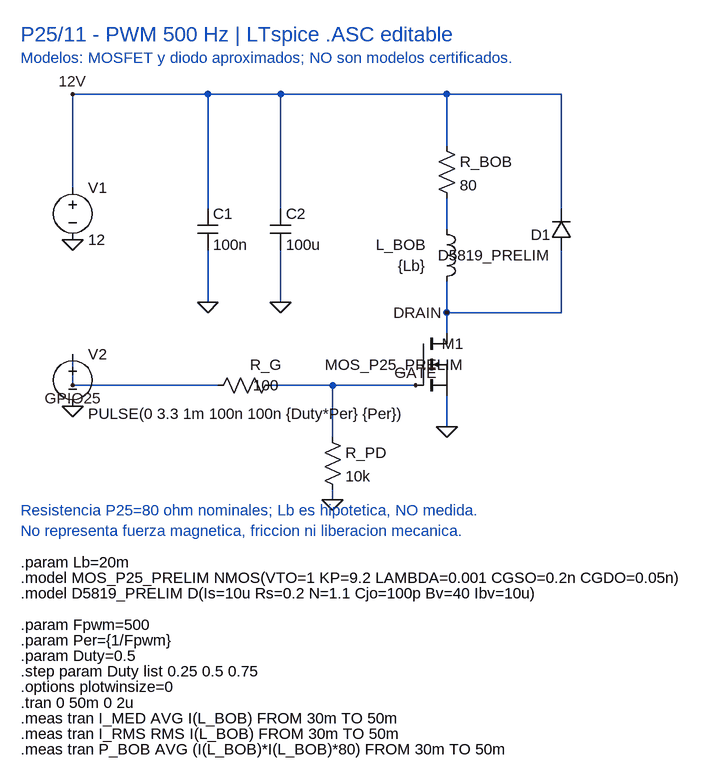
[diagram p0: schematic 03_P25_PWM_25_50_75.asc]
03_P25_PWM_25_50_75.asc, the LTspice schematic file:
Version 4
SHEET 1 1600 1200
WIRE 128 112 336 112
WIRE 336 112 448 112
WIRE 448 112 704 112
WIRE 704 112 880 112
WIRE 128 112 128 256
WIRE 336 112 336 288
WIRE 336 352 336 432
WIRE 448 112 448 288
WIRE 448 352 448 432
WIRE 704 112 704 192
WIRE 704 272 704 320
WIRE 704 400 704 448
WIRE 704 448 704 480
WIRE 704 576 704 624
WIRE 880 112 880 288
WIRE 880 352 880 448
WIRE 704 448 880 448
WIRE 128 512 128 560
WIRE 128 560 352 560
WIRE 432 560 528 560
WIRE 528 560 656 560
WIRE 528 560 528 640
WIRE 528 720 528 736
FLAG 128 112 12V
FLAG 704 448 DRAIN
FLAG 656 560 GATE
FLAG 128 560 GPIO25
FLAG 128 336 0
FLAG 128 592 0
FLAG 336 432 0
FLAG 448 432 0
FLAG 528 736 0
FLAG 704 624 0
SYMBOL voltage 128 240 R0
SYMATTR InstName V1
SYMATTR Value 12
SYMBOL cap 320 288 R0
SYMATTR InstName C1
SYMATTR Value 100n
SYMBOL cap 432 288 R0
SYMATTR InstName C2
SYMATTR Value 100u
SYMBOL res 688 176 R0
SYMATTR InstName R_BOB
SYMATTR Value 80
SYMBOL ind 688 304 R0
WINDOW 0 -16 40 Right 2
WINDOW 3 -16 72 Right 2
SYMATTR InstName L_BOB
SYMATTR Value {Lb}
SYMBOL nmos 656 480 R0
WINDOW 0 74 16 Right 2
WINDOW 3 74 48 Right 2
SYMATTR InstName M1
SYMATTR Value MOS_P25_PRELIM
SYMBOL res 448 544 R90
WINDOW 0 0 22 VBottom 2
WINDOW 3 0 22 VTop 2
SYMATTR InstName R_G
SYMATTR Value 100
SYMBOL res 512 624 R0
SYMATTR InstName R_PD
SYMATTR Value 10k
SYMBOL diode 896 352 R180
WINDOW 0 32 24 Left 2
WINDOW 3 32 -8 Left 2
SYMATTR InstName D1
SYMATTR Value D5819_PRELIM
SYMBOL voltage 128 496 R0
WINDOW 3 24 108 Left 2
SYMATTR InstName V2
SYMATTR Value PULSE(0 3.3 1m 100n 100n {Duty*Per} {Per})
TEXT 48 20 Left 3 P25/11 - PWM 500 Hz | LTspice .ASC editable
TEXT 48 56 Left 2 Modelos: MOSFET y diodo aproximados; NO son modelos certificados.
TEXT 48 752 Left 2 Resistencia P25=80 ohm nominales; Lb es hipotetica, NO medida.
TEXT 48 784 Left 2 No representa fuerza magnetica, friccion ni liberacion mecanica.
TEXT 48 832 Left 2 !.param Lb=20m
TEXT 48 856 Left 2 !.model MOS_P25_PRELIM NMOS(VTO=1 KP=9.2 LAMBDA=0.001 CGSO=0.2n CGDO=0.05n)
TEXT 48 880 Left 2 !.model D5819_PRELIM D(Is=10u Rs=0.2 N=1.1 Cjo=100p Bv=40 Ibv=10u)
TEXT 48 928 Left 2 !.param Fpwm=500
TEXT 48 952 Left 2 !.param Per={1/Fpwm}
TEXT 48 976 Left 2 !.param Duty=0.5
TEXT 48 1000 Left 2 !.step param Duty list 0.25 0.5 0.75
TEXT 48 1024 Left 2 !.options plotwinsize=0
TEXT 48 1048 Left 2 !.tran 0 50m 0 2u
TEXT 48 1072 Left 2 !.meas tran I_MED AVG I(L_BOB) FROM 30m TO 50m
TEXT 48 1096 Left 2 !.meas tran I_RMS RMS I(L_BOB) FROM 30m TO 50m
TEXT 48 1120 Left 2 !.meas tran P_BOB AVG (I(L_BOB)*I(L_BOB)*80) FROM 30m TO 50m

The netlist it stands for:
* 03_P25_PWM_25_50_75.asc
V1 12V 0 12
C1 12V 0 100n
C2 12V 0 100u
R_BOB 12V N001 80
L_BOB N001 DRAIN {Lb}
M1 DRAIN GATE 0 0 MOS_P25_PRELIM
R_G GATE GPIO25 100
R_PD GATE 0 10k
D1 DRAIN 12V D5819_PRELIM
V2 GPIO25 0 PULSE(0 3.3 1m 100n 100n {Duty*Per} {Per})
.model D D
.lib standard.dio
.model NMOS NMOS
.model PMOS PMOS
.lib standard.mos
* P25/11 - PWM 500 Hz | LTspice .ASC editable
* Modelos: MOSFET y diodo aproximados; NO son modelos certificados.
* Resistencia P25=80 ohm nominales; Lb es hipotetica, NO medida.
* No representa fuerza magnetica, friccion ni liberacion mecanica.
.param Lb=20m
.model MOS_P25_PRELIM NMOS(VTO=1 KP=9.2 LAMBDA=0.001 CGSO=0.2n CGDO=0.05n)
.model D5819_PRELIM D(Is=10u Rs=0.2 N=1.1 Cjo=100p Bv=40 Ibv=10u)
.param Fpwm=500
.param Per={1/Fpwm}
.param Duty=0.5
.step param Duty list 0.25 0.5 0.75
.options plotwinsize=0
.tran 0 50m 0 2u
.meas tran I_MED AVG I(L_BOB) FROM 30m TO 50m
.meas tran I_RMS RMS I(L_BOB) FROM 30m TO 50m
.meas tran P_BOB AVG (I(L_BOB)*I(L_BOB)*80) FROM 30m TO 50m
.backanno
.end